# EAGLE design Actuator Control Circuit (final) (EAGLE 9.6.2)
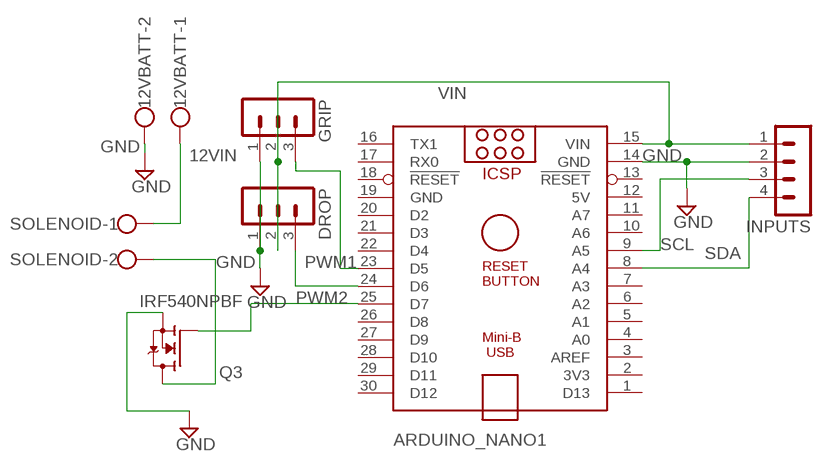
[diagram p0: schematic, sheet 1]

## Parts
12VBATT  W237-102  [W237-102]
ARDUINO_NANO1  ARDUINO_NANO  [ARDUINO_NANO]
DROP  MA03-1  [MA03-1]
GRIP  MA03-1  [MA03-1]
INPUTS  MA04-1  [MA04-1]
Q3  IRF540NPBF  [TO254P1054X469X1930-3]
SOLENOID  W237-102  [W237-102]

## Nets
12VIN: 12VBATT.1 SOLENOID.1
GND: 12VBATT.2 ARDUINO_NANO1.14(GND) DROP.1 GRIP.1 INPUTS.2 Q3.3(S)
N$1: ARDUINO_NANO1.25(D7) Q3.1(G)
N$3: Q3.2(D) SOLENOID.2
PWM1: ARDUINO_NANO1.23(D5) GRIP.3
PWM2: ARDUINO_NANO1.24(D6) DROP.3
SCL: ARDUINO_NANO1.9(A5) INPUTS.3
SDA: ARDUINO_NANO1.8(A4) INPUTS.4
VIN: ARDUINO_NANO1.15(VIN) DROP.2 GRIP.2 INPUTS.1
Unconnected: ARDUINO_NANO1.1(D13) ARDUINO_NANO1.2(3V3) ARDUINO_NANO1.3(AREF) ARDUINO_NANO1.4(A0) ARDUINO_NANO1.5(A1) ARDUINO_NANO1.6(A2) ARDUINO_NANO1.7(A3) ARDUINO_NANO1.10(A6) ARDUINO_NANO1.11(A7) ARDUINO_NANO1.13(!RESET) ARDUINO_NANO1.16(TX1) ARDUINO_NANO1.17(RX0) ARDUINO_NANO1.18(!RESET) ARDUINO_NANO1.20(D2) ARDUINO_NANO1.21(D3) ARDUINO_NANO1.22(D4) ARDUINO_NANO1.26(D8) ARDUINO_NANO1.27(D9) ARDUINO_NANO1.28(D10) ARDUINO_NANO1.29(D11) ARDUINO_NANO1.30(D12)

## Power pins joined to a net without a drawn wire
5V: ARDUINO_NANO1.12(5V)
GND: ARDUINO_NANO1.19(GND)

## Library data of the parts
12VBATT SOLENOID = con-wago-500:W237-102: WAGO SCREW CLAMP; MPN: 237-102; OC_FARNELL: unknown; OC_NEWARK: 70K9898
ARDUINO_NANO1 = ArduinoNanoV30:ARDUINO_NANO: Arduino Nano V3.0 Overview: The Arduino Nano is a small, complete, and breadboard-friendly board based on the ATmega328 (Arduino Nano 3.x) or ATmega168 (Arduino Nano 2.x). It has more or less the same functionality of the Arduino Duemilanove, but in a different package. It lacks only a DC power jack, and works with a Mini-B USB cable instead of a standard one. The Nano was designed and is being produced by Gravitech. Specifications: Microcontroller Atmel ATmega168 or ATmega328 Operating Voltage (logic level) 5 V Input Voltage (recommended) 7-12 V Input Voltage (limits) 6-20 V Digital I/O Pins 14 (of which 6 provide PWM output) Analog Input Pins 8 DC Current per I/O Pin 40 mA Flash Memory 16 KB (ATmega168) or 32 KB (ATmega328) of which 2 KB used by bootloader SRAM 1 KB (ATmega168) or 2 KB (ATmega328) EEPROM 512 bytes (ATmega168) or 1 KB (ATmega328) Clock Speed 16 MHz Dimensions 0.73" x 1.70" Length 45 mm Width 18 mm Weigth 5 g Power: The Arduino Nano can be powered via the Mini-B USB connection, 6-20V unregulated external power supply (pin 30), or 5V regulated external power supply (pin 27). The power source is automatically selected to the highest voltage source. Memory: The ATmega168 has 16 KB of flash memory for storing code (of which 2 KB is used for the bootloader); the ATmega328 has 32 KB, (also with 2 KB used for the bootloader). The ATmega168 has 1 KB of SRAM and 512 bytes of EEPROM (which can be read and written with the EEPROM library); the ATmega328 has 2 KB of SRAM and 1 KB of EEPROM. Input and Output: Each of the 14 digital pins on the Nano can be used as an input or output, using pinMode(), digitalWrite(), and digitalRead() functions. They operate at 5 volts. Each pin can provide or receive a maximum of 40 mA and has an internal pull-up resistor (disconnected by default) of 20-50 kOhms. In addition, some pins have specialized functions. Visit Arduino - ArduinoBoardNano <https://www.arduino.cc/en/Main/ArduinoBoardNano>
DROP GRIP = con-lstb:MA03-1: PIN HEADER; OC_FARNELL: unknown; OC_NEWARK: unknown
INPUTS = con-lstb:MA04-1: PIN HEADER; OC_FARNELL: unknown; OC_NEWARK: unknown
Q3 = IRF540NPBF:IRF540NPBF: Check availability <https://pricing.snapeda.com/parts/IRF540NPBF/Infineon/view-part?ref=eda>; AVAILABILITY: In Stock; DESCRIPTION: RoHS Compliant | Low RDS(on) | Industry-leading quality | Dynamic dv/dt Rating | Fast Switching | Fully Avalanche Rated | 175C Operating Temperature; MF: Infineon; MP: IRF540NPBF; PACKAGE: TO-220 Infineon; PRICE: None; PURCHASE-URL: https://pricing.snapeda.com/search/part/IRF540NPBF/?ref=eda

## Board
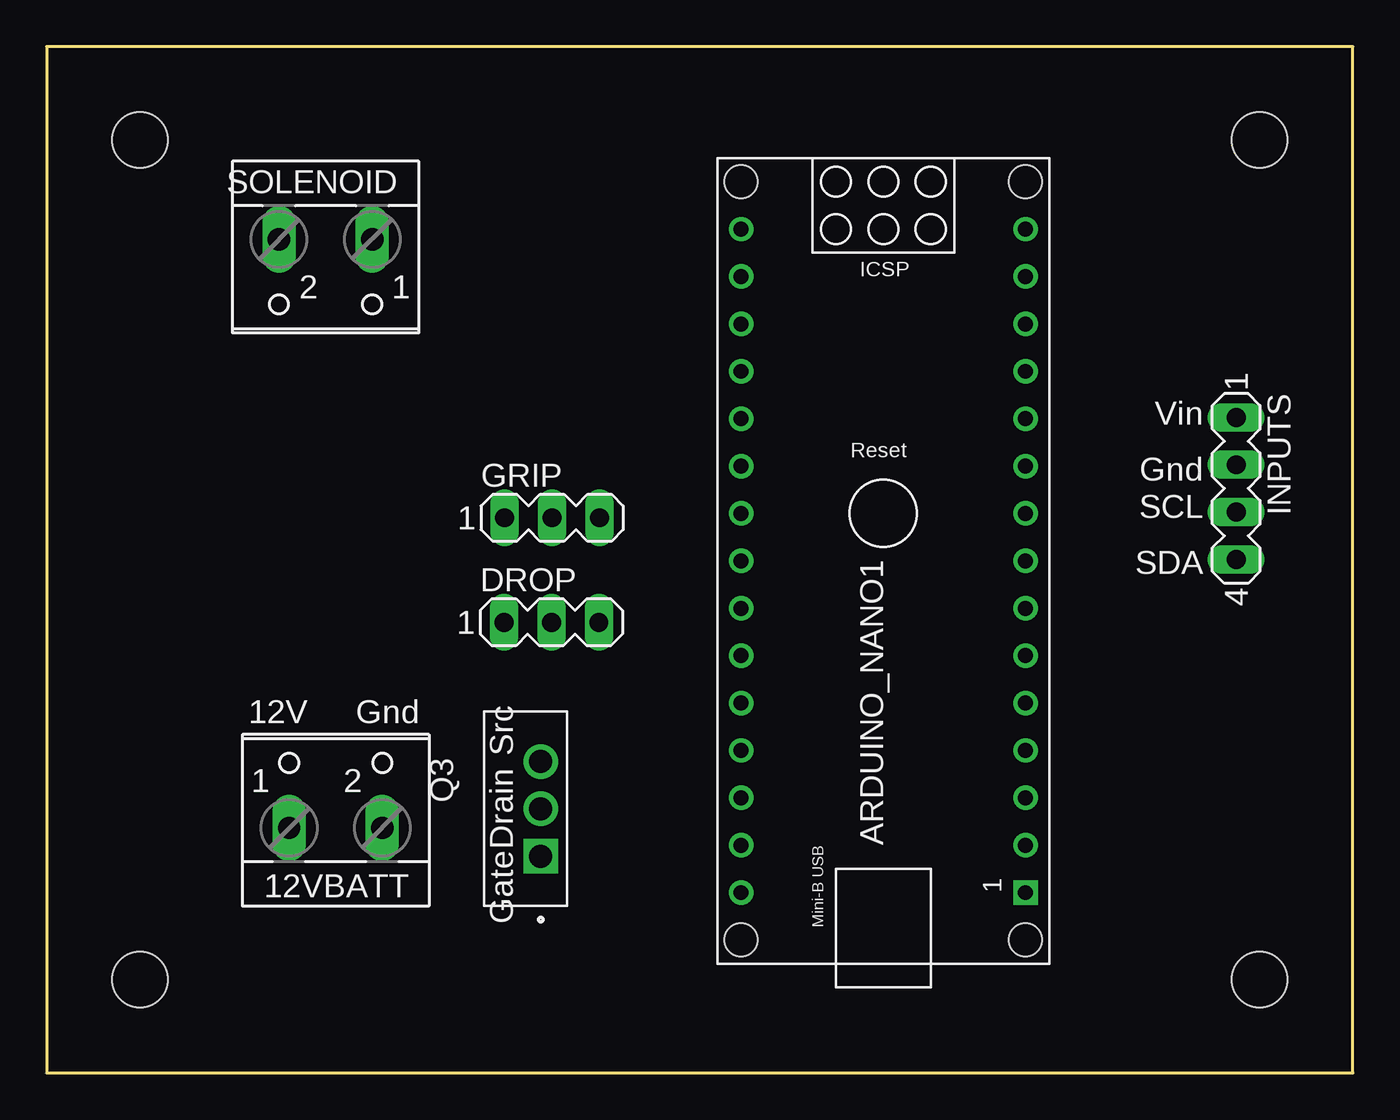
[diagram p1: board, top side]
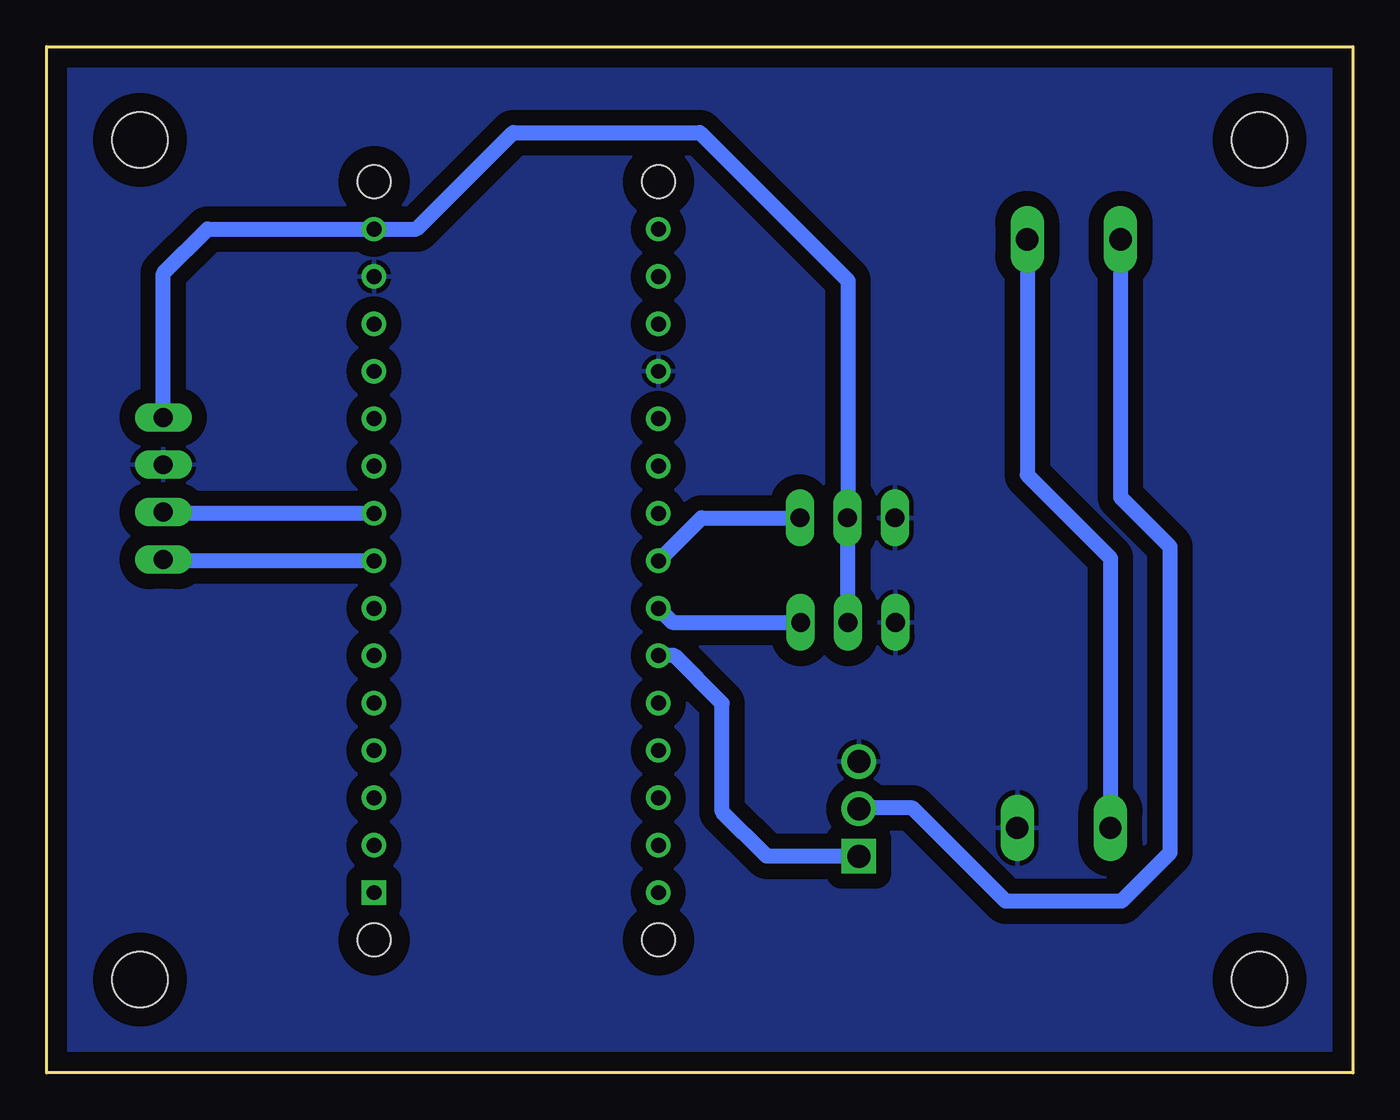
[diagram p2: board, bottom side, seen from below]

Size 70 x 55 mm. Coordinates in mm from the lower left corner, seen from the top.
Outline: 0,0 70,0 70,55 0,55 0,0
Copper layers (1*16): Top 0.035mm / dielectric 1.5mm / Bottom 0.035mm
Design rules "default": minimum track width 6mil, minimum drill 0.35mm, track to track 6mil, track to pad 6mil, pad to pad 6mil, via to via 6mil, smd to smd 6mil, copper to edge 40mil, drill to drill 6mil, minimum pad ring 10mil, minimum via ring 8mil, stop-mask expansion 4mil, vias tented up to drill 0mil, thermal gap 10mil
Holes 3 mm at 5,5 5,50 65,50 65,5

### Footprints (pad centres in the part's own frame; a part is rotated, then mirrored left to right if it is on the bottom)
W237-102 = drill 1.194 long: 1 -2.5,-1.27; 2 2.5,-1.27
ARDUINO_NANO = drill 0.8 square: 1 -20.32,-7.62 | drill 0.8: 2 -17.78,-7.62; 3 -15.24,-7.62; 4 -12.7,-7.62; 5 -10.16,-7.62; 6 -7.62,-7.62; 7 -5.08,-7.62; 8 -2.54,-7.62; 9 0,-7.62; 10 2.54,-7.62; 11 5.08,-7.62; 12 7.62,-7.62; 13 10.16,-7.62; 14 12.7,-7.62; 15 15.24,-7.62; 16 15.24,7.62; 17 12.7,7.62; 18 10.16,7.62; 19 7.62,7.62; 20 5.08,7.62; 21 2.54,7.62; 22 0,7.62; 23 -2.54,7.62; 24 -5.08,7.62; 25 -7.62,7.62; 26 -10.16,7.62; 27 -12.7,7.62; 28 -15.24,7.62; 29 -17.78,7.62; 30 -20.32,7.62 | hole 1.778: -22.86,-7.62; -22.86,7.62; 17.78,7.62; 17.78,-7.62
MA03-1 = drill 1.016 long: 1 -2.54,0; 2 0,0; 3 2.54,0
MA04-1 = drill 1.016 long: 1 -3.81,0; 2 -1.27,0; 3 1.27,0; 4 3.81,0
TO254P1054X469X1930-3 = drill 1.23 square: 1 -2.54,-0.81 | drill 1.23: 2 0,-0.81; 3 2.54,-0.81

### Placement (x,y rotation side)
12VBATT  15.49,14.4 0 top
ARDUINO_NANO1  44.84,29.98 90 top
DROP  27.05,24.15 0 top
GRIP  27.09,29.75 0 top
INPUTS  63.75,31.32 270 top
Q3  25.67,14.15 90 top
SOLENOID  14.95,43.4 180 top

### Tracks (layer width: path | path; a pad name or v marks a point on that pad's centre or on a via)
12VIN
  Bottom 0.813: SOLENOID.1 17.45,32.05 12.99,27.59 12VBATT.1
GND
  pour Bottom (isolate 0.813): 0,55 0,0 70,0 70,55
N$1
  Bottom 0.813: Q3.1 31.41,11.61 33.8,14 33.8,19.8 36.36,22.36 ARDUINO_NANO1.25
N$3
  Bottom 0.813: SOLENOID.2 12.45,30.85 9.8,28.2 9.8,11.8 12.4,9.2 18.6,9.2 23.6,14.2 26.43,14.2 Q3.2
PWM1
  Bottom 0.813: ARDUINO_NANO1.23 34.91,29.75 GRIP.3
PWM2
  Bottom 0.813: ARDUINO_NANO1.24 36.47,24.15 DROP.3
SCL
  Bottom 0.813: ARDUINO_NANO1.9 63.68,29.98 INPUTS.3
SDA
  Bottom 0.813: ARDUINO_NANO1.8 63.68,27.44 INPUTS.4
VIN
  Bottom 0.813: INPUTS.1 63.75,42.85 61.38,45.22 ARDUINO_NANO1.15 50.18,45.22 45,50.4 35,50.4 27.05,42.45 27.05,29.71 | DROP.2 27.05,29.71 | 27.05,29.71 GRIP.2

### Text on the board
tNames: Vin | Gnd | SCL | SDA | 12V | Gnd | Src | Drain | Gate